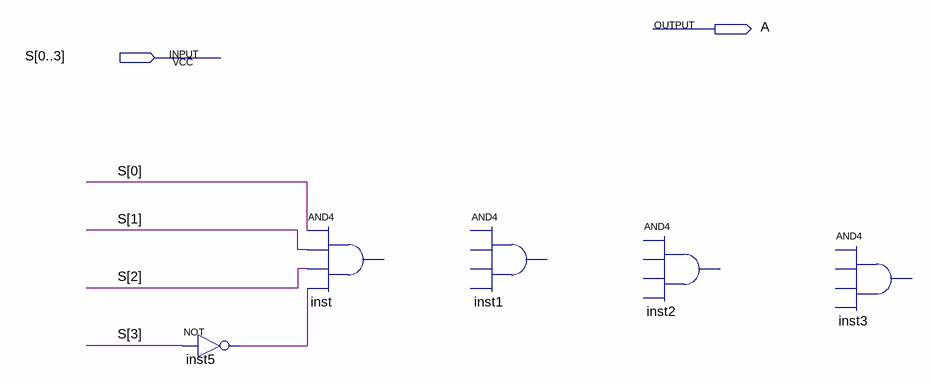
[diagram p0: schematic sheet]
// Quartus schematic CONVERSORA.bdf as structural Verilog: 5 symbols, 2 pins
module CONVERSORA (
  input  [0:3] S,
  output A
);

  wire inst5_out;

  not inst5 (inst5_out, S[3]);
  // AND4 inst has open pins: IN1=S[0], IN2=S[1], IN3=S[2], IN4=inst5_out, OUT=open
  // AND4 inst1 is placed but not wired
  // AND4 inst2 is placed but not wired
  // AND4 inst3 is placed but not wired
endmodule
